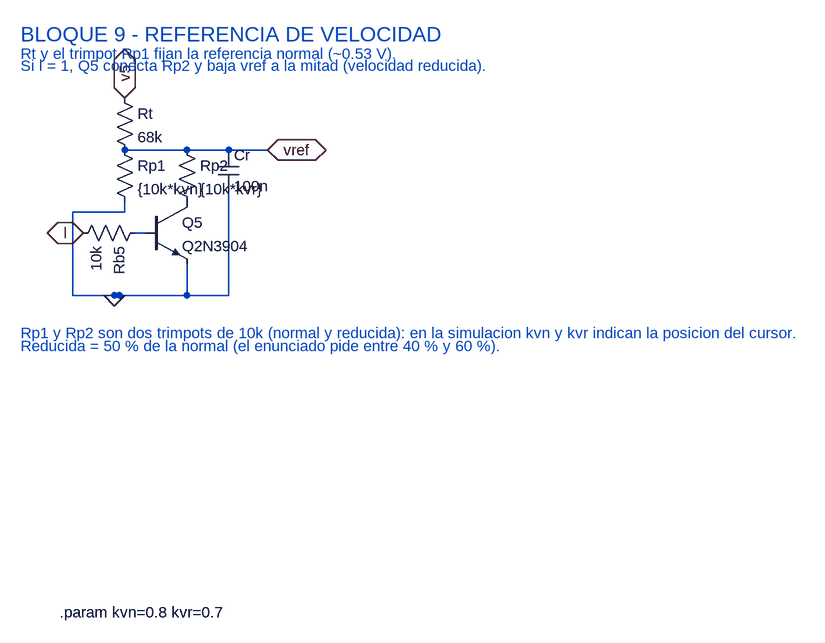
[diagram p0: schematic BLOQUE_REFVEL.asc]
BLOQUE_REFVEL.asc, the LTspice schematic file:
Version 4
SHEET 1 900 600
WIRE 0 48 96 48
WIRE 96 48 160 48
WIRE 160 48 220 48
WIRE 16 176 32 176
WIRE -16 272 160 272
WIRE -16 272 -8 272
WIRE 96 224 96 272
WIRE 0 128 0 144
WIRE 0 144 -80 144
WIRE -80 144 -80 272
WIRE -80 272 -16 272
WIRE 160 112 160 272
FLAG 0 -32 v5
FLAG 220 48 vref
FLAG -64 176 l
FLAG -16 272 0
IOPIN 0 -32 BiDir
IOPIN 220 48 BiDir
IOPIN -64 176 BiDir
SYMBOL res -16 -48 R0
SYMATTR InstName Rt
SYMATTR Value 68k
SYMBOL res -16 32 R0
SYMATTR InstName Rp1
SYMATTR Value {10k*kvn}
SYMBOL res 80 32 R0
SYMATTR InstName Rp2
SYMATTR Value {10k*kvr}
SYMBOL npn 32 128 R0
SYMATTR InstName Q5
SYMATTR Value Q2N3904
SYMBOL res 32 160 R90
SYMATTR InstName Rb5
SYMATTR Value 10k
SYMBOL cap 144 48 R0
SYMATTR InstName Cr
SYMATTR Value 100n
TEXT -160 -130 Left 3 ;BLOQUE 9 - REFERENCIA DE VELOCIDAD
TEXT -160 -100 Left 2 ;Rt y el trimpot Rp1 fijan la referencia normal (~0.53 V).
TEXT -160 -82 Left 2 ;Si l = 1, Q5 conecta Rp2 y baja vref a la mitad (velocidad reducida).
TEXT -160 330 Left 2 ;Rp1 y Rp2 son dos trimpots de 10k (normal y reducida): en la simulacion kvn y kvr indican la posicion del cursor.
TEXT -160 350 Left 2 ;Reducida = 50 % de la normal (el enunciado pide entre 40 % y 60 %).
TEXT -100 760 Left 2 !.param kvn=0.8 kvr=0.7

The netlist it stands for:
* BLOQUE_REFVEL.asc
Rt v5 vref 68k
Rp1 vref 0 {10k*kvn}
Rp2 vref P001 {10k*kvr}
Q5 P001 N001 0 0 Q2N3904
Rb5 N001 l 10k
Cr vref 0 100n
.model NPN NPN
.model PNP PNP
.lib standard.bjt
* BLOQUE 9 - REFERENCIA DE VELOCIDAD
* Rt y el trimpot Rp1 fijan la referencia normal (~0.53 V).
* Si l = 1, Q5 conecta Rp2 y baja vref a la mitad (velocidad reducida).
* Rp1 y Rp2 son dos trimpots de 10k (normal y reducida): en la simulacion kvn y kvr indican la posicion del cursor.
* Reducida = 50 % de la normal (el enunciado pide entre 40 % y 60 %).
.param kvn=0.8 kvr=0.7
.backanno
.end